# Altium schematic sheet Switching_Section.SchDoc
size A4; DocumentNumber: 4; SheetNumber: 4; SheetTotal: 5
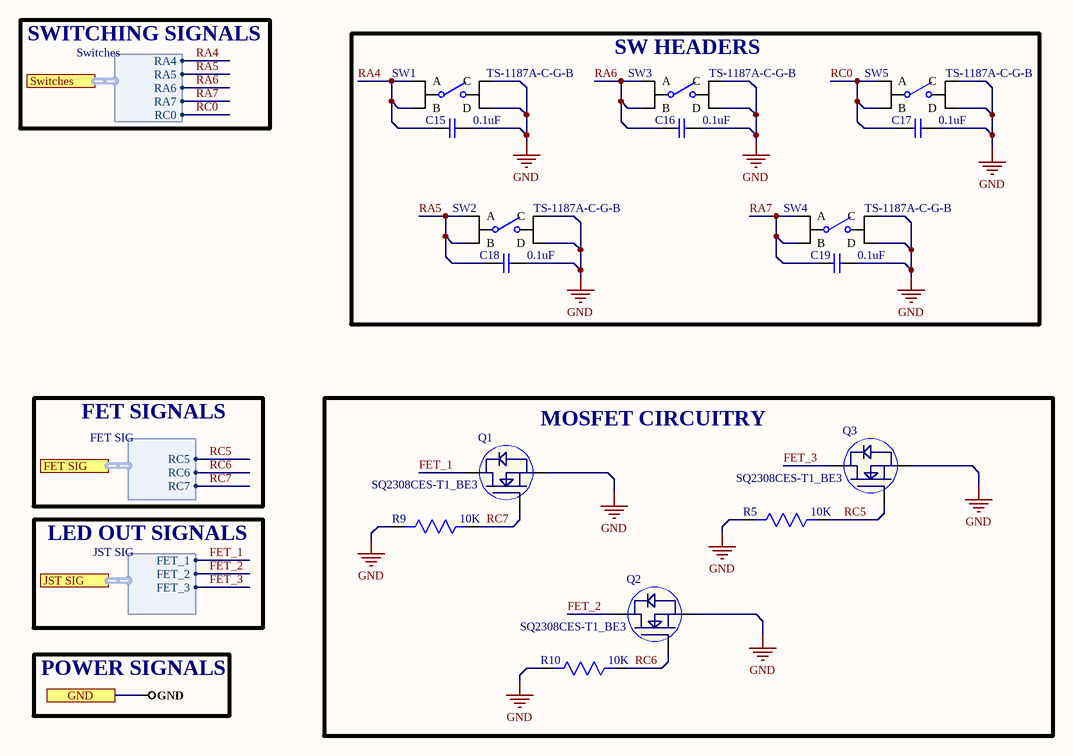
[diagram p0: Switching_Section.SchDoc]

## Parts
C15  0.1uF  [CAP 0201]
C16  0.1uF  [CAP 0201]
C17  0.1uF  [CAP 0201]
C18  0.1uF  [CAP 0201]
C19  0.1uF  [CAP 0201]
Q1  SQ2308CES-T1_BE3  [SQ2308CES-T1_BE3]
Q2  SQ2308CES-T1_BE3  [SQ2308CES-T1_BE3]
Q3  SQ2308CES-T1_BE3  [SQ2308CES-T1_BE3]
R5  10K  [RES 0805]
R9  10K  [RES 0805]
R10  10K  [RES 0805]
SW1  TS-1187A-C-G-B  [TS-1187A-C-G-B]
SW2  TS-1187A-C-G-B  [TS-1187A-C-G-B]
SW3  TS-1187A-C-G-B  [TS-1187A-C-G-B]
SW4  TS-1187A-C-G-B  [TS-1187A-C-G-B]
SW5  TS-1187A-C-G-B  [TS-1187A-C-G-B]

## Blocks framed on the sheet
SW HEADERS: C15-C19 SW1-SW5
MOSFET CIRCUITRY: Q1-Q3 R5 R9 R10

## Ports
FET SIG (harness FET SIG), GND, JST SIG (harness JST SIG), Switches (harness Switches)

## Harnesses
FET SIG: RC5, RC6, RC7
Switches: RA4, RA5, RA6, RA7, RC0
JST SIG: FET_1, FET_2, FET_3

## Nets
GND: C15.2 C16.2 C17.2 C18.2 C19.2 Q1.2(S) Q2.2(S) Q3.2(S) R5.1 R9.1 R10.1 SW1.3(C) SW1.4(D) SW2.3(C) SW2.4(D) SW3.3(C) SW3.4(D) SW4.3(C) SW4.4(D) SW5.3(C) SW5.4(D) ; port GND
FET_1: Q1.3(D) ; port JST SIG.FET_1
FET_2: Q2.3(D) ; port JST SIG.FET_2
FET_3: Q3.3(D) ; port JST SIG.FET_3
RA4: C15.1 SW1.1(A) SW1.2(B) ; port Switches.RA4
RA5: C18.1 SW2.1(A) SW2.2(B) ; port Switches.RA5
RA6: C16.1 SW3.1(A) SW3.2(B) ; port Switches.RA6
RA7: C19.1 SW4.1(A) SW4.2(B) ; port Switches.RA7
RC0: C17.1 SW5.1(A) SW5.2(B) ; port Switches.RC0
RC5: Q3.1(G) R5.2 ; port FET SIG.RC5
RC6: Q2.1(G) R10.2 ; port FET SIG.RC6
RC7: Q1.1(G) R9.2 ; port FET SIG.RC7

## Notes on the sheet
- SWITCHING SIGNALS
- FET SIGNALS
- LED OUT SIGNALS
- POWER SIGNALS

## Library data of the parts
C15-C19 = GRM033R61E104KE14D: CAP CER 0.1UF 25V X5R 0201; Manufacturer: Murata; Capacitance: 100nF; Tolerance: 10%; Supplier 1: Mouser; Manufacturer Part Number: GRM033R61E104KE14D; RoHS: Yes; Category: Ceramic Capacitors; Stock 1: 19728; Pricing 1: 1=0.12000, 10=0.05600, 50=0.05600, 100=0.02500, 1000=0.01400, 10000=0.01100 (USD); Mount: Surface Mount; Case/Package: 0201; Case Code (Metric): 0603; Case Code (Imperial): 0201; Weight: 1.2E-05oz; Min Operating Temperature: -55°C; Max Operating Temperature: 85°C; Packaging: Tape and Reel; Voltage Rating: 25V; Dielectric: X5R; Termination: SMD/SMT; Resistor Type: Ceramic; Voltage Rating (DC): 25V; Package Quantity: 15000; Length: 0.024inch; Width: 0.012inch; Height: 0.3mm; Thickness: 0.013inch; Lead Free: Lead Free; RoHS Compliant: Yes; ComponentLink1URL: http://www.farnell.com/datasheets/2867843.pdf?src-supplier=Farnell; ComponentLink1Description: http://www.farnell.com/datasheets/2867843.pdf?src-supplier=Farnell; ComponentLink2URL: http://www.mouser.com/ds/2/281/c02e-2905.pdf?src-supplier=Mouser; ComponentLink2Description: http://www.mouser.com/ds/2/281/c02e-2905.pdf?src-supplier=Mouser; ComponentLink3URL: http://search.murata.co.jp/Ceramy/image/img/A01X/G101/ENG/GRM033R61E104KE14-01.pdf?src-supplier=Digi-Key; ComponentLink3Description: http://search.murata.co.jp/Ceramy/image/img/A01X/G101/ENG/GRM033R61E104KE14-01.pdf?src-supplier=Digi-Key; ComponentLink4URL: http://www.farnell.com/datasheets/2867843.pdf?src-supplier=Newark; ComponentLink4Description: http://www.farnell.com/datasheets/2867843.pdf?src-supplier=Newark; Supplier Part Number 1: 81-GRM033R61E104KE4D
Q1-Q3 = SQ2308CES-T1_BE3: MOSFET N-CHANNEL 60V (D-S); Manufacturer: Vishay; Supplier 1: Avnet; Manufacturer Part Number: SQ2308CES-T1_BE3; RoHS: No; Stock 1: 2862; Pricing 1: 1=0.64000, 25=0.50800, 50=0.45700, 100=0.40600, 250=0.36300, 500=0.31900 (USD); Supplier Part Number 1: 80AH8959
R5 R9 R10 = 0805W8F1002T5E: ±1% 1/8W Thick Film Resistors 150V ±100ppm/℃ -55℃~+155℃ 10kΩ 0805 Chip Resistor - Surface Mount ROHS; Manufacturer: UNI-ROYAL; Manufacturer Part No: 0805W8F1002T5E; Package: 0805; Value: 10kΩ
SW1-SW5 = TS-1187A-C-G-B: 5.1mm 3.5mm Round Button 50mA To 5.1mm SPST 12V SMD Tactile Switche; Manufacturer: XKB; Manufacturer Part No: TS-1187A-C-G-B; Package: Custom; ComponentLink1Description: LCSC; ComponentLink1URL: https://lcsc.com/product-detail/Tactile-Switches_XKB-Enterprise-TS-1187A-C-G-A_C318886.html